# Altium schematic sheet 02_ADV7611_HDMI_IN.SchDoc
size A3; SheetNumber: 3; SheetTotal: 6
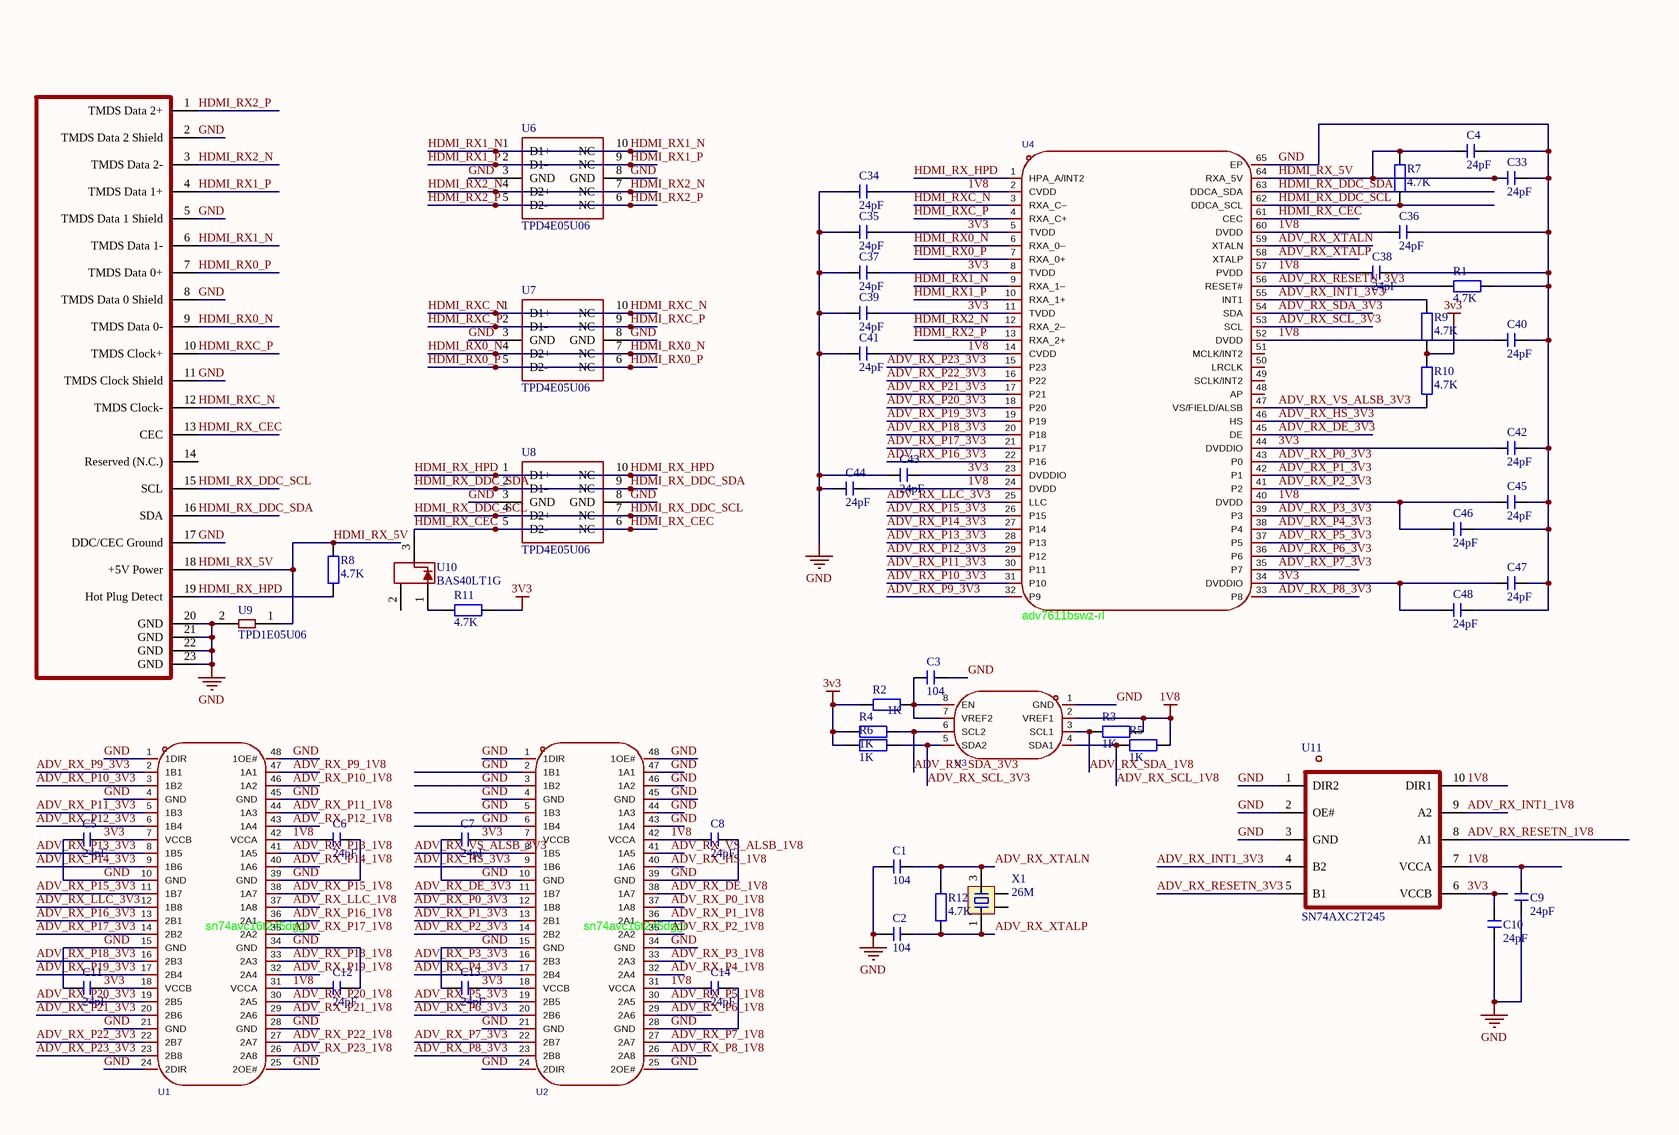
[diagram p0: 02_ADV7611_HDMI_IN.SchDoc, left]

## Parts
C1  104  [C 0603_L]
C2  104  [C 0603_L]
C3  104  [C 0603_L]
C4  24pF  [C 0603_L]
C5  24pF  [C 0603_L]
C6  24pF  [C 0603_L]
C7  24pF  [C 0603_L]
C8  24pF  [C 0603_L]
C9  24pF  [C 0603_L]
C10  24pF  [C 0603_L]
C11  24pF  [C 0603_L]
C12  24pF  [C 0603_L]
C13  24pF  [C 0603_L]
C14  24pF  [C 0603_L]
C33  24pF  [C 0603_L]
C34  24pF  [C 0603_L]
C35  24pF  [C 0603_L]
C36  24pF  [C 0603_L]
C37  24pF  [C 0603_L]
C38  24pF  [C 0603_L]
C39  24pF  [C 0603_L]
C40  24pF  [C 0603_L]
C41  24pF  [C 0603_L]
C42  24pF  [C 0603_L]
C43  24pF  [C 0603_L]
C44  24pF  [C 0603_L]
C45  24pF  [C 0603_L]
C46  24pF  [C 0603_L]
C47  24pF  [C 0603_L]
C48  24pF  [C 0603_L]
R1  4.7K  [R 0603_L]
R2  1K  [R 0603_L]
R3  1K  [R 0603_L]
R4  1K  [R 0603_L]
R5  1K  [R 0603_L]
R6  1K  [R 0603_L]
R7  4.7K  [R 0603_L]
R8  4.7K  [R 0603_L]
R9  4.7K  [R 0603_L]
R10  4.7K  [R 0603_L]
R11  4.7K  [R 0603_L]
R12  4.7K  [R 0603_L]
U1  sn74avc16t245dggr  [TSSOP-48_L12.6-W6.2-P0.50-LS8.1-BL]
U2  sn74avc16t245dggr  [TSSOP-48_L12.6-W6.2-P0.50-LS8.1-BL]
U3  pca9306dqer  [X2SON-8_L1.4-W1.0-P0.35-BL]  (value not drawn)
U4  adv7611bswz-rl  [LQFP-64_L10.0-W10.0-P0.50-LS12.0-TL-EP5.3]
U6  TPD4E05U06  [TPD4E05U06DQAR]
U7  TPD4E05U06  [TPD4E05U06DQAR]
U8  TPD4E05U06  [TPD4E05U06DQAR]
U9  TPD1E05U06  [TPD1E05U06]
U10  BAS40LT1G  [BAS40LT1G]
U11  SN74AXC2T245  [SN74AXC2T245]
USB1  hdmi-001s  [HDMI-SMD_HDMI-001S]  (value not drawn)
X1  26M  [OSC 1612-4P]

## Nets
1V8: C6.1 C8.1 C9.2 C12.1 C14.1 C34.2 C36.1 C38.1 C40.1 C41.2 C44.2 C45.1 C46.1 R3.2 R5.2 U1.31(VCCA) U1.42(VCCA) U2.31(VCCA) U2.42(VCCA) U3.2(VREF1) U4.2(CVDD) U4.14(CVDD) U4.24(DVDD) U4.40(DVDD) U4.52(DVDD) U4.57(PVDD) U4.60(DVDD) U11.7(VCCA) U11.10(DIR1)
3V3: C5.2 C7.2 C10.2 C11.2 C13.2 C35.2 C37.2 C39.2 C42.1 C43.2 C47.1 C48.1 R2.2 R4.1 R6.1 R9.2 R10.1 R11.2 U1.7(VCCB) U1.18(VCCB) U2.7(VCCB) U2.18(VCCB) U4.5(TVDD) U4.8(TVDD) U4.11(TVDD) U4.23(DVDDIO) U4.34(DVDDIO) U4.44(DVDDIO) U11.6(VCCB)
GND: C1.1 C2.1 C3.2 C4.2 C5.1 C6.2 C7.1 C8.2 C9.1 C10.1 C11.1 C12.2 C13.1 C14.2 C33.2 C34.1 C35.1 C36.2 C37.1 C38.2 C39.1 C40.2 C41.1 C42.2 C43.1 C44.1 C45.2 C46.2 C47.2 C48.2 R1.2 U1.1(1DIR) U1.4(GND) U1.10(GND) U1.15(GND) U1.21(GND) U1.24(2DIR) U1.25(2OE#) U1.28(GND) U1.34(GND) U1.39(GND) U1.45(GND) U1.48(1OE#) U2.1(1DIR) U2.2(1B1) U2.3(1B2) U2.4(GND) U2.5(1B3) U2.6(1B4) U2.10(GND) U2.15(GND) U2.21(GND) U2.24(2DIR) U2.25(2OE#) U2.28(GND) U2.34(GND) U2.39(GND) U2.43(1A4) U2.44(1A3) U2.45(GND) U2.46(1A2) U2.47(1A1) U2.48(1OE#) U3.1(GND) U4.65(EP) U6.3(GND) U6.8(GND) U7.3(GND) U7.8(GND) U8.3(GND) U8.8(GND) U9.2(GND) U11.1(DIR2) U11.2(OE#) U11.3(GND) USB1.2(TMDS_Data_2_Shield) USB1.5(TMDS_Data_1_Shield) USB1.8(TMDS_Data_0_Shield) USB1.11(TMDS_Clock_Shield) USB1.17(DDC/CEC_Ground) USB1.20(GND) USB1.21(GND) USB1.22(GND) USB1.23(GND)
ADV_RX_DE_1V8: U2.38(1A7)
ADV_RX_DE_3V3: U2.11(1B7) U4.45(DE)
ADV_RX_HS_1V8: U2.40(1A6)
ADV_RX_HS_3V3: U2.9(1B6) U4.46(HS)
ADV_RX_INT1_1V8: U11.9(A2)
ADV_RX_INT1_3V3: R9.1 U4.55(INT1) U11.4(B2)
ADV_RX_LLC_1V8: U1.37(1A8)
ADV_RX_LLC_3V3: U1.12(1B8) U4.25(LLC)
ADV_RX_P0_1V8: U2.37(1A8)
ADV_RX_P0_3V3: U2.12(1B8) U4.43(P0)
ADV_RX_P1_1V8: U2.36(2A1)
ADV_RX_P1_3V3: U2.13(2B1) U4.42(P1)
ADV_RX_P2_1V8: U2.35(2A2)
ADV_RX_P2_3V3: U2.14(2B2) U4.41(P2)
ADV_RX_P3_1V8: U2.33(2A3)
ADV_RX_P3_3V3: U2.16(2B3) U4.39(P3)
ADV_RX_P4_1V8: U2.32(2A4)
ADV_RX_P4_3V3: U2.17(2B4) U4.38(P4)
ADV_RX_P5_1V8: U2.30(2A5)
ADV_RX_P5_3V3: U2.19(2B5) U4.37(P5)
ADV_RX_P6_1V8: U2.29(2A6)
ADV_RX_P6_3V3: U2.20(2B6) U4.36(P6)
ADV_RX_P7_1V8: U2.27(2A7)
ADV_RX_P7_3V3: U2.22(2B7) U4.35(P7)
ADV_RX_P8_1V8: U2.26(2A8)
ADV_RX_P8_3V3: U2.23(2B8) U4.33(P8)
ADV_RX_P9_1V8: U1.47(1A1)
ADV_RX_P9_3V3: U1.2(1B1) U4.32(P9)
ADV_RX_P10_1V8: U1.46(1A2)
ADV_RX_P10_3V3: U1.3(1B2) U4.31(P10)
ADV_RX_P11_1V8: U1.44(1A3)
ADV_RX_P11_3V3: U1.5(1B3) U4.30(P11)
ADV_RX_P12_1V8: U1.43(1A4)
ADV_RX_P12_3V3: U1.6(1B4) U4.29(P12)
ADV_RX_P13_1V8: U1.41(1A5)
ADV_RX_P13_3V3: U1.8(1B5) U4.28(P13)
ADV_RX_P14_1V8: U1.40(1A6)
ADV_RX_P14_3V3: U1.9(1B6) U4.27(P14)
ADV_RX_P15_1V8: U1.38(1A7)
ADV_RX_P15_3V3: U1.11(1B7) U4.26(P15)
ADV_RX_P16_1V8: U1.36(2A1)
ADV_RX_P16_3V3: U1.13(2B1) U4.22(P16)
ADV_RX_P17_1V8: U1.35(2A2)
ADV_RX_P17_3V3: U1.14(2B2) U4.21(P17)
ADV_RX_P18_1V8: U1.33(2A3)
ADV_RX_P18_3V3: U1.16(2B3) U4.20(P18)
ADV_RX_P19_1V8: U1.32(2A4)
ADV_RX_P19_3V3: U1.17(2B4) U4.19(P19)
ADV_RX_P20_1V8: U1.30(2A5)
ADV_RX_P20_3V3: U1.19(2B5) U4.18(P20)
ADV_RX_P21_1V8: U1.29(2A6)
ADV_RX_P21_3V3: U1.20(2B6) U4.17(P21)
ADV_RX_P22_1V8: U1.27(2A7)
ADV_RX_P22_3V3: U1.22(2B7) U4.16(P22)
ADV_RX_P23_1V8: U1.26(2A8)
ADV_RX_P23_3V3: U1.23(2B8) U4.15(P23)
ADV_RX_RESETN_1V8: U11.8(A1)
ADV_RX_RESETN_3V3: R1.1 U4.56(RESET#) U11.5(B1)
ADV_RX_SCL_1V8: R5.1 U3.4(SDA1)
ADV_RX_SCL_3V3: R6.2 U3.5(SDA2) U4.53(SCL)
ADV_RX_SDA_1V8: R3.1 U3.3(SCL1)
ADV_RX_SDA_3V3: R4.2 U3.6(SCL2) U4.54(SDA)
ADV_RX_VS_ALSB_1V8: U2.41(1A5)
ADV_RX_VS_ALSB_3V3: R10.2 U2.8(1B5) U4.47(VS/FIELD/ALSB)
ADV_RX_XTALN: C1.2 R12.2 U4.59(XTALN) X1.3
ADV_RX_XTALP: C2.2 R12.1 U4.58(XTALP) X1.1
HDMI_RX0_N: U4.6(RXA_0–) U7.4(D2+) U7.7(NC) USB1.9(TMDS_Data_0-)
HDMI_RX0_P: U4.7(RXA_0+) U7.5(D2-) U7.6(NC) USB1.7(TMDS_Data_0+)
HDMI_RX1_N: U4.9(RXA_1–) U6.1(D1+) U6.10(NC) USB1.6(TMDS_Data_1-)
HDMI_RX1_P: U4.10(RXA_1+) U6.2(D1-) U6.9(NC) USB1.4(TMDS_Data_1+)
HDMI_RX2_N: U4.12(RXA_2–) U6.4(D2+) U6.7(NC) USB1.3(TMDS_Data_2-)
HDMI_RX2_P: U4.13(RXA_2+) U6.5(D2-) U6.6(NC) USB1.1(TMDS_Data_2+)
HDMI_RX_5V: C4.1 C33.1 R7.2 R8.1 U4.64(RXA_5V) U9.1(IO) USB1.18(+5V_Power)
HDMI_RX_CEC: U4.61(CEC) U8.5(D2-) U8.6(NC) U10.3 USB1.13(CEC)
HDMI_RX_DDC_SCL: R7.1 U4.62(DDCA_SCL) U8.4(D2+) U8.7(NC) USB1.15(SCL)
HDMI_RX_DDC_SDA: U4.63(DDCA_SDA) U8.2(D1-) U8.9(NC) USB1.16(SDA)
HDMI_RX_HPD: R8.2 U4.1(HPA_A/INT2) U8.1(D1+) U8.10(NC) USB1.19(Hot_Plug_Detect)
HDMI_RXC_N: U4.3(RXA_C–) U7.1(D1+) U7.10(NC) USB1.12(TMDS_Clock-)
HDMI_RXC_P: U4.4(RXA_C+) U7.2(D1-) U7.9(NC) USB1.10(TMDS_Clock+)
NetC3_1: C3.1 R2.1 U3.7(VREF2) U3.8(EN)
NetR11_1: R11.1 U10.1

Not connected (* = marked no-connect by the designer): U4 48(AP) 49(SCLK/INT2) 50(LRCLK) 51(MCLK/INT2); U10 2; USB1 14(Reserved_(N.C.)); X1 2 4

## Library data of the parts
C1-C14 C33-C48 = C: 贴片电容; BOM名称: 无极性贴片电容; 淘宝ID: 封装库来自淘宝 ID：黄晶宝石; 联系售后: https://shop463601444.taobao.com
R1-R12 = R: 贴片电阻; 版权归属: 来自淘宝 ID：黄晶宝石; BOM名称: 贴片电阻; 联系售后: https://shop463601444.taobao.com
U1 U2 = sn74avc16t245dggr: SN74AVC16T245 具有可配置电压转换和三态输出的 16 位双电源总线收发器; Manufacturer: TI(德州仪器); AddInBom: yes; ModelId: 3630bc8bc65c4ae4913ce685d85b0283; ModelName: TSSOP-48_L12.6-W6.1-H1.0-LS8.1-P0.50; ModelTransform: 318.898,496.063,0,90,0,0,0,0.0045,0; Symbol: SN74AVC16T245DGGR; LCSC Part Name: 具备可配置电平转换/电压转换功能和三态输出的16位双电源总线收发器; SupplierPart: C148481; ManufacturerPart: SN74AVC16T245DGGR; Supplier Footprint: TSSOP-48-6.2mm; JLCPCB Part Class: Extended Part; Datasheet: https://www.ti.com/cn/lit/gpn/sn74avc16t245; Supplier: LCSC; ConvertToPcb: yes; FootprintName: TSSOP-48_L12.6-W6.2-P0.50-LS8.1-BL
U3 = pca9306dqer: 数据速率:-;工作电压(VCCA):-;工作电压(VCCB):-;元件数:-;每个电路通道数:2;; Manufacturer: TI(德州仪器); AddInBom: yes; ModelId: ca9e004a924f4dd0ba6981db82d16128; ModelName: X2SON-8_L1.4-W1.0-H0.4-P0.35-BL; ModelTransform: 55.118,40.05354,0,180,0,0,0.003,0.603,0; Channel Type: 双向; Number of Circuits: 2; Output Type: 开漏; Symbol: PCA9306DQER; LCSC Part Name: 双路双向I²C总线和SMBus电压电平转换器; SupplierPart: C440032; ManufacturerPart: PCA9306DQER; Supplier Footprint: X2-SON-8(0.8x1.4); JLCPCB Part Class: Extended Part; Datasheet: https://www.ti.com/cn/lit/gpn/pca9306; Supplier: LCSC; ConvertToPcb: yes; FootprintName: X2SON-8_L1.4-W1.0-P0.35-BL; Input Signal: -; Output Signal: -; Data Rate: -; Voltage - Supply(VCCA): -; Voltage - Supply(VCCB): -; Number of Elements: -; Operating Temperature: -40℃~+85℃; Features: -
U4 = adv7611bswz-rl: ADV7611提供汽车级、专业级(无HDCP)和工业级三种版本，工作温度范围为 -40 °C 至 +85 °C。是一款高质量、单输入HDMI接收器，内置HDMI兼容型接收器，支持HDMI 1.4a规定的所有强制性3D电视格式，和最高UXGA 60 Hz、8位的分辨率。它集成一个CEC控制器，支持CDC特性。具有一个音频输出端口，用于输出从HDMI流提取的音频数据。HDMI接收器具有高级静音控制器，可消除音频输出中的外来声频噪声。支持来自I2S串行器的音频流(两个音频通道)、来自S/PDIF串行器的音频流(; Manufacturer: ADI(亚德诺); AddInBom: yes; ModelId: cd9de06618c44fcf82654c43a457f83c; ModelName: LQFP-64_L10.0-W10.0-H1.4-LS12.0-P0.50; ModelTransform: 472.441,472.441,0,270,0,0,0,0,0; Symbol: ADV7611BSWZ-RL; LCSC Part Name: 低功耗165 MHz HDMI接收器; SupplierPart: C706706; ManufacturerPart: ADV7611BSWZ-RL; Supplier Footprint: LQFP-64(10x10); JLCPCB Part Class: Extended Part; Datasheet: https://item.szlcsc.com/datasheet/ADV7611BSWZ-RL/743801.html; Supplier: LCSC; ConvertToPcb: yes; FootprintName: LQFP-64_L10.0-W10.0-P0.50-LS12.0-TL-EP5.3
U6-U8 = TPD4E05U06: TVS 5V ESD
U9 = TPD1E05U06: 单通道ESD
U10 = BAS40LT1G: 肖特基二极管
USB1 = hdmi-001s: 19PIN A型前插后贴HDMI插座 铜壳; Manufacturer: XUNPU(讯普); AddInBom: yes; ModelId: 95350f9f774e4f059b8c605506db97f9; ModelTransform: 590.5878,468.503,0,0,0,0,0,-79.567,-85.039; Connector Type: HDMI-A; Gender: 母; Symbol: HDMI-001S; LCSC Part Name: HDMI-A 母 19P; SupplierPart: C720616; ManufacturerPart: HDMI-001S; Supplier Footprint: SMD; JLCPCB Part Class: Extended Part; Datasheet: https://item.szlcsc.com/datasheet/HDMI-001S/763623.html; Supplier: LCSC; ConvertToPcb: yes; FootprintName: HDMI-SMD_HDMI-001S; ModelName: HDMI-SMD_HDMI-001S; Number of Pins: 19P; Mounting Type: 卧贴; Current Rating: -; Voltage Rating: -; Operating Temperature: -
X1 = XTAL-4P: 4脚无源晶振; 版权归属: 源创客; BOM名称: 4脚无源晶振; 学习资源: www.ooocke.com